# Altium project RF-PCB.PrjPcb
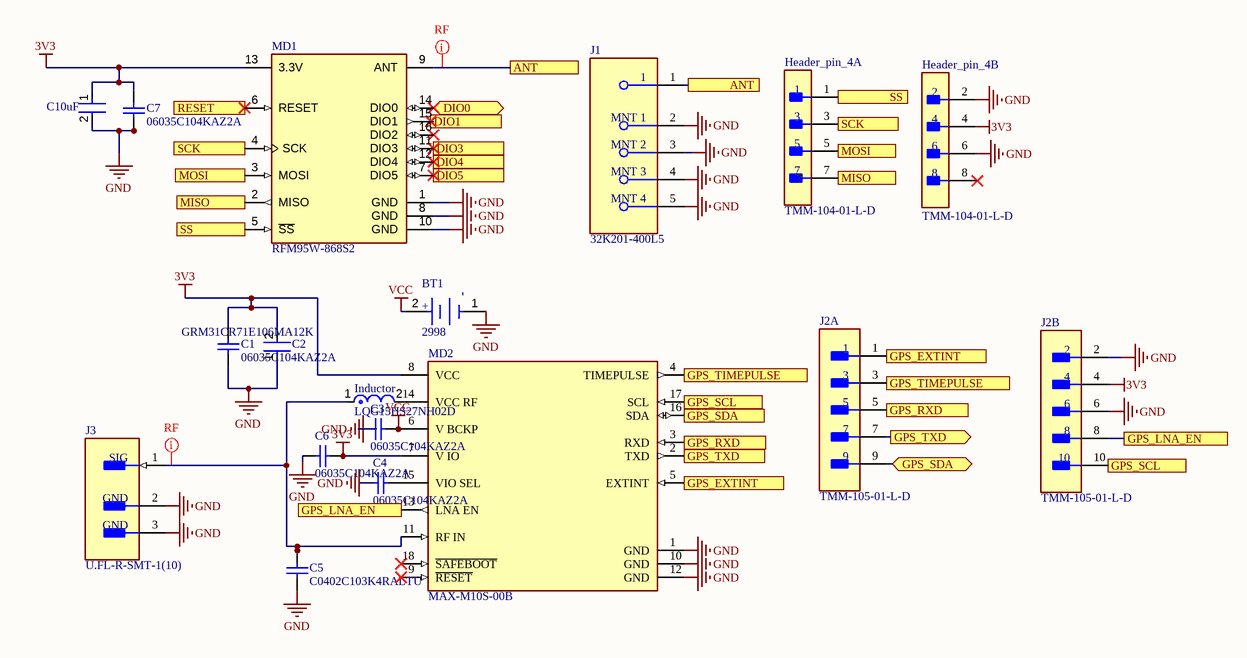
[diagram p0: Radio_gps_module.SchDoc]
CAGE_CODE: ?????; CONTRACT_NUMBER: <CONTRACT NO>; DOC_NO_ASSY_DWG: <ASSY DWG NO>; DOC_NO_BOM: <BOM DOC NO>; DOC_NO_FAB_DWG: <FAB DWG NO>; DOC_NO_SCH_DWG: <SCH DWG NO>; PCB_2_DEC_TOL: +/-.01; PCB_3_DEC_TOL: +/-.010; PCB_ANG_TOL: +/-1/2; PCB_ASSEMBLY_NO: <PCB ASSY NO>; PCB_CHECKER: - -----; PCB_CHECKER_APP_DATE: --/--/----; PCB_DESIGNER: - -----; PCB_DESIGNER_APP_DATE: --/--/----; PCB_DWG_NO: <PCB DWG NO>; PCB_ENGINEER: - -----; PCB_ENGINEER_APP_DATE: --/--/----; PCB_PART_NUMBER: <PCB PN>; PCB_REV: A; SCH_REV: A
1 sheet, 16 parts. Net scope: flat (ports and power ports of the same name join across sheets).
Board file: GPS.PcbDoc

## Sheet Radio_gps_module.SchDoc
size 431 x 279 mm; SheetNumber: 1; SheetTotal: 1; ENG_APP_DATE: --/--/--; DSN_APP_DATE: --/--/--; CHK_APP_DATE: --/--/--

### Parts
BT1  2998  [FP-2998-MFG]
C1  06035C104KAZ2A  [CAPC1608X90X35LL15T15]
C2  GRM31CR71E106MA12K  [FP-GRM31C-0_2-e0_3_0_8-IPC_B]
C3  06035C104KAZ2A  [CAPC1608X90X35LL15T15]
C4  06035C104KAZ2A  [CAPC1608X90X35LL15T15]
C5  C0402C103K4RALTU  [CAPC1005X60X30NL05T10]
C6  06035C104KAZ2A  [CAPC1608X90X35NL15T15]
C7  06035C104KAZ2A  [CAPC1608X90X35LL15T15]
C10uF  GRM188R61A106KE69D  [FP-GRM18-0_15-MFG]  (value not drawn)
Header_pin_4  TMM-104-01-L-D  [FP-TMM-104-01-L-D-MFG]  (parts A,B of 2)
Inductor  LQG15HS27NH02D  [FP-LQG15HH_02-IPC_A]
J1  32K201-400L5  [FP-32K201-400L5-MFG]
J2  TMM-105-01-L-D  [FP-TMM-105-01-L-D-MFG]  (parts A,B of 2)
J3  U.FL-R-SMT-1(10)  [FP-U_FL-R-SMT-1_10-MFG]
MD1  RFM95W-868S2  [FP-RFM95W-868S2-MFG]
MD2  MAX-M10S-00B  [FP-MAX-M10S-00B-MFG]

### Ports
ANT, DIO0 (bidir), DIO1, DIO3, DIO4, DIO5, GPS_EXTINT, GPS_EXTINT (in), GPS_LNA_EN, GPS_RXD, GPS_RXD (in), GPS_SCL, GPS_SCL (in), GPS_SDA, GPS_SDA (bidir), GPS_TIMEPULSE, GPS_TIMEPULSE (out), GPS_TXD, GPS_TXD (out), MISO, MISO (out), MOSI, MOSI (in), RESET, SCK, SS, SS (in)

### Nets
3V3: C1.2 C2.2 C6.2 C7.2 C10uF.1 Header_pin_4.4 J2.4 MD1.13(3.3V) MD2.7(V_IO) MD2.8(VCC)
GND: BT1.1(C) C1.1 C2.1 C3.1 C4.1 C5.1 C6.1 C7.1 C10uF.2 Header_pin_4.2 Header_pin_4.6 J1.2(MNT_1) J1.3(MNT_2) J1.4(MNT_3) J1.5(MNT_4) J2.2 J2.6 J3.2(GND) J3.3(GND) MD1.1(GND) MD1.8(GND) MD1.10(GND) MD2.1(GND) MD2.10(GND) MD2.12(GND)
VCC: BT1.2(A) C3.2 MD2.6(V_BCKP)
NetC4_2: C4.2 MD2.15(VIO_SEL)
NetC5_2: C5.2 Inductor.1 J3.1(SIG) MD2.11(RF_IN)
NetHeader_pin_4_1: Header_pin_4.1 MD1.5(~{SS}) ; port SS
NetHeader_pin_4_3: Header_pin_4.3 MD1.4(SCK) ; port SCK
NetHeader_pin_4_5: Header_pin_4.5 MD1.3(MOSI) ; port MOSI
NetHeader_pin_4_7: Header_pin_4.7 MD1.2(MISO) ; port MISO
NetInductor_2: Inductor.2 MD2.14(VCC_RF)
NetJ1_1: J1.1 MD1.9(ANT) ; port ANT
NetJ2_1: J2.1 MD2.5(EXTINT) ; port GPS_EXTINT
NetJ2_3: J2.3 MD2.4(TIMEPULSE) ; port GPS_TIMEPULSE
NetJ2_5: J2.5 MD2.3(RXD) ; port GPS_RXD
NetJ2_7: J2.7 MD2.2(TXD) ; port GPS_TXD
NetJ2_8: J2.8 MD2.13(LNA_EN) ; port GPS_LNA_EN
NetJ2_9: J2.9 MD2.16(SDA) ; port GPS_SDA
NetJ2_10: J2.10 MD2.17(SCL) ; port GPS_SCL
NetMD1_6: MD1.6(RESET) ; port RESET
NetMD1_7: MD1.7(DIO5) ; port DIO5
NetMD1_11: MD1.11(DIO3) ; port DIO3
NetMD1_12: MD1.12(DIO4) ; port DIO4
NetMD1_14: MD1.14(DIO0) ; port DIO0
NetMD1_15: MD1.15(DIO1) ; port DIO1

Not connected (* = marked no-connect by the designer): Header_pin_4 8*; MD1 16(DIO2)*; MD2 9(~{RESET})* 18(~{SAFEBOOT})*

### Layout directives
net class RF: NetC5_2, NetJ1_1

### Notes on the sheet
- DWG. NO.
- REV.
- SHT.
- THIS DOCUMENT AND THE DATA DISCLOSED HEREIN OR HEREWITH IS THE PROPERTY OF ALTIUM LIMITED AND MAY BE FREELY DISTRIBUTED IN WHOLE. NO RIGHTS ARE RESERVED OR EXPRESS OR IMPLIED WARANTEE GIVEN.
- REVISION
- DESCRIPTION
- DATE
- APPROVED
- ENG:
- APPROVALS
- PROJECT
- DSN:
- CHK:
- REFERENCE DOCUMENTS
- PROJECT REVISION:
- TITLE
- DOCUMENT REVISION:
- DESIGN ITEM:
- BOM:
- FAB DWG:
- PCB DWG:
- ASSY DWG:
- SCALE:
- SIZE
- B
- CAGE CODE
- FILE NAME
- DWG NO.
- SHEET
- OF
- REV
- (in symbol CMP-19636-000010-1) -; +

### Library data of the parts
BT1 = CMP-19636-000010-1: BATTERY RETAINER COIN 6.8MM SMD; Number of Batteries: 1; Package Quantity: 100; Mount: Surface Mount; Case/Package: SMD/SMT; Number of Cells: 1; REACH SVHC: No SVHC; Height: 2.9mm; Contact Material: Bronze; Material: Bronze; Lead Free: Lead Free; Termination: SMD/SMT; Color: Silver
C1 C3 C4 C6 C7 = CMP-2006-04391-1: Manufacturer: AVX Interconnect / Elco; Part Number: 06035C104KAZ2A
C2 = CMP-06035-043219-1: Chip Multilayer Ceramic Capacitors for General Purpose, 1206, 10uF, X7R, 15%, 20%, 25V
C5 = CMP-2008-02128-1: Manufacturer: Kemet; Part Number: C0402C103K4RALTU
C10uF = CMP-2000-05448-2: CAP CER 10UF 10V X5R 0603; Manufacturer: Murata; Temperature Coefficient: 15%; Material: Ceramic; Tolerance: 10%; Device Class L1: Passive Components; ComponentLink2Description: Datasheet; Height: 0.95mm; Package: GRM18-0.15; Octopart: https://octopart.com/grm188r61a106ke69d-murata-22851381; Manufacturer Part Number: GRM188R61A106KE69D; Value: 10uF; Digikey Description: CAP CER 10UF 10V X5R 0603; Temperature Range High: +85°C; Temperature Range Low: -55°C; Temperature Characteristic: X5R; Capacitance: 10uF; RoHS: TRUE; Device Class L2: Capacitors; ComponentLink2URL: https://search.murata.co.jp/Ceramy/image/img/A01X/G101/ENG/GRM188R61A106KE69-01A.pdf; Device Class L3: Ceramic Capacitors; Lead Free: Yes; Mouser Description: Multilayer Ceramic Capacitors MLCC - SMD/SMT 0603 10uF 10volts X5R + - 10%; Category: Cap; Voltage Rating: 10V; Temperature: -55°C to +85°C; Automotive: No
Header_pin_4 = CMP-02766-001625-1: CONN HEADER VERT 8POS 2MM; Max Current Rating: 3.9A; Number of Positions: 8; Gender: Male; Max Voltage Rating (AC): 500V; RoHS Compliant: Yes; Series: TMM; Length: 8mm; Packaging: Bulk; Housing Material: Polymer; Orientation: Straight; Contact Type: Male Pin; Number of Rows: 2; REACH SVHC: No SVHC; Insulation Material: Polymer; Pitch: 2mm; Number of Contacts: 8; Insulation Color: Black; Radiation Hardening: No; Housing Color: Black; Max Operating Temperature: 125°C; Connector Type: Header; Lead Free: Lead Free; Min Operating Temperature: -55°C; Fastening Type: Pull; Contact Material: Bronze; Termination: Solder; Depth: 3.94mm; Contact Shape: Square; Contact Plating: Gold; Contact Finish - Mating: GOLD
Inductor = CMP-06042-007099-1: Multilayer type RF Inductor 27nH ±3% 0.46Ω 350mA 0402; Self Resonant Frequency: 1.7GHz; Core Material: Air; Test Frequency: 100MHz; DC Resistance (DCR): 460mR; Shielding: Unshielded; Case Code (Metric): 1005; Inductance: 27nH; Current Rating: 350mA; Min Operating Temperature: -55°C; Packaging: Tape and Reel; Mount: Surface Mount; Case/Package: 0402; Case Code (Imperial): 0402; Max Operating Temperature: 125°C; Tolerance: 3%
J1 = CMP-0751-00005-2: CONN SMA JACK R/A 50OHM PCB; Gender: Female; Body Plating: Gold; Dielectric Material: PTFE; Mating Cycles: 500; Max Frequency: 18GHz; Body Material: Brass; Number of Ports: 1; Impedance: 50R; Voltage Rating: 480V; RoHS Compliant: Yes; Termination: Solder; Housing Color: Gold; Case/Package: SMA; Series: -; Center Contact Plating: Gold; Contact Plating: Gold; Max Operating Temperature: 165°C; Contact Material: Copper; Fastening Type: Threaded; Packaging: Bulk; Connector Type: SMA; Min Operating Temperature: -65°C
J2 = CMP-02766-001634-1: CONN HEADER VERT 10POS 2MM; Gender: Male; Max Current Rating: 3.9A; Number of Contacts: 10; Max Voltage Rating (AC): 500V; Lead Free: Lead Free; Number of Rows: 2; Radiation Hardening: No; RoHS Compliant: Yes; Length: 10mm; Depth: 3.94mm; Orientation: Straight; Packaging: Bulk; REACH SVHC: No SVHC; Max Operating Temperature: 125°C; Contact Material: Bronze; Pitch: 2mm; Min Operating Temperature: -55°C; Termination: Solder; Housing Color: Black; Contact Plating: Gold; Housing Material: Polymer
J3 = CMP-2000-05152-3: CONN U.FL RCPT STR 50 OHM SMD; Max Frequency: 6GHz; Connector Type: Coaxial; Body Plating: Silver; Body Material: Bronze; Impedance: 50R; Dielectric Material: Polymer; Insulation Resistance: 500MR; Gender: Male; Packaging: Cut Tape; Length: 3mm; Package Quantity: 2500; Termination: Solder; Lead Free: Lead Free; Series: U.FL; Min Operating Temperature: -40°C; Fastening Type: Snap; Contact Material: Brass; Orientation: Straight; Wire/Cable Type: Coaxial; Frequency: 6GHz; Contact Plating: Gold; Depth: 3.1mm; Weight: 0.001764oz; Max Operating Temperature: 90°C; Radiation Hardening: No; REACH SVHC: No SVHC; Mount: Surface Mount; Housing Color: Beige
MD1 = CMP-204316-000001-1: RX TXRX MODULE ISM < 1GHZ SMD; Data Rate: 300Kbps; Frequency: 868MHz; Sensitivity: -123dBm; Interface: SPI; Current - Transmitting: 120mA; Current - Receiving: 12.1mA; Max Operating Temperature: 70°C; Case/Package: SMD/SMT; Packaging: Bulk; Mount: Surface Mount; Min Operating Temperature: -20°C
MD2 = CMP-207130-000026-1: GNSS LCC RX, ROM, TCXO, LNA, SAW